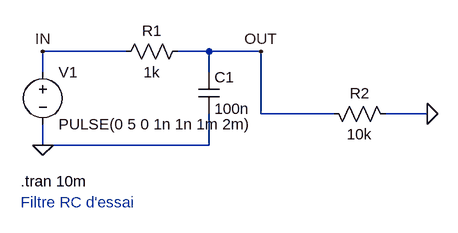
[diagram p0: schematic rc.asc]
rc.asc, the LTspice schematic file:
Version 4
SHEET 1 880 680
WIRE 96 96 -32 96
WIRE 224 96 176 96
WIRE 304 96 224 96
WIRE -32 128 -32 96
WIRE 224 128 224 96
WIRE 304 192 304 96
WIRE 416 192 304 192
WIRE 560 192 496 192
WIRE -32 240 -32 208
WIRE 224 240 224 192
WIRE 224 240 -32 240
FLAG -32 240 0
FLAG -32 96 IN
FLAG 304 96 OUT
FLAG 560 192 0
SYMBOL voltage -32 112 R0
WINDOW 123 0 0 Left 0
WINDOW 39 0 0 Left 0
SYMATTR InstName V1
SYMATTR Value PULSE(0 5 0 1n 1n 1m 2m)
SYMBOL res 192 80 R90
WINDOW 0 0 56 VBottom 2
WINDOW 3 32 56 VTop 2
SYMATTR InstName R1
SYMATTR Value 1k
SYMBOL cap 208 128 R0
SYMATTR InstName C1
SYMATTR Value 100n
SYMBOL res 400 176 M90
WINDOW 0 0 56 VBottom 2
WINDOW 3 32 56 VTop 2
SYMATTR InstName R2
SYMATTR Value 10k
TEXT -66 296 Left 2 !.tran 10m
TEXT -66 328 Left 2 ;Filtre RC d'essai

The netlist it stands for:
* rc.asc
V1 IN 0 PULSE(0 5 0 1n 1n 1m 2m)
R1 OUT IN 1k
C1 OUT 0 100n
R2 OUT 0 10k
.tran 10m
* Filtre RC d'essai
.backanno
.end